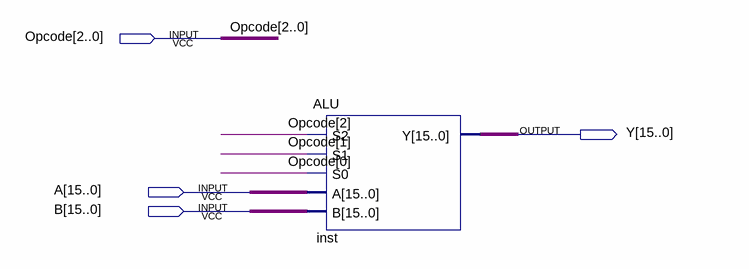
[diagram p0: schematic sheet]
// Quartus schematic mach_cuoi.bdf as structural Verilog: 1 symbols, 4 pins
module mach_cuoi (
  input  [2:0] Opcode,
  input  [15:0] A,
  input  [15:0] B,
  output [15:0] Y
);

  ALU inst (.S2(Opcode[2]), .S1(Opcode[1]), .S0(Opcode[0]), .A(A), .B(B), .Y(Y));
endmodule
